# Altium schematic sheet Top_Sheet.SchDoc
size A4; DocumentNumber: 1; SheetNumber: 1; SheetTotal: 5
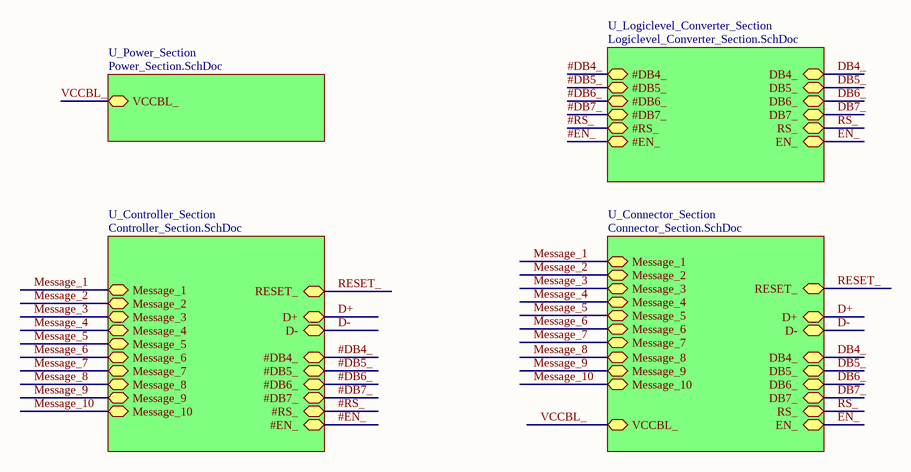
[diagram p0: Top_Sheet.SchDoc]

## Sub-sheets
U_Connector_Section = Connector_Section.SchDoc: RESET_ (bidir), D+ (bidir), Message_7 (bidir), DB4_ (bidir), Message_6 (bidir), Message_5 (bidir), Message_4 (bidir), Message_3 (bidir), Message_2 (bidir), Message_1 (bidir), Message_10 (bidir), Message_8 (bidir), Message_9 (bidir), D- (bidir), DB5_ (bidir), DB6_ (bidir), DB7_ (bidir), RS_ (bidir), EN_ (bidir), VCCBL_ (bidir)
U_Controller_Section = Controller_Section.SchDoc: D+ (bidir), RESET_ (bidir), D- (bidir), #DB4_ (bidir), #DB5_ (bidir), #DB6_ (bidir), #DB7_ (bidir), #RS_ (bidir), #EN_ (bidir), Message_10 (bidir), Message_9 (bidir), Message_8 (bidir), Message_7 (bidir), Message_6 (bidir), Message_5 (bidir), Message_4 (bidir), Message_3 (bidir), Message_2 (bidir), Message_1 (bidir)
U_Logiclevel_Converter_Section = Logiclevel_Converter_Section.SchDoc: DB4_ (bidir), DB5_ (bidir), DB6_ (bidir), DB7_ (bidir), RS_ (bidir), EN_ (bidir), #DB4_ (bidir), #DB5_ (bidir), #DB6_ (bidir), #DB7_ (bidir), #RS_ (bidir), #EN_ (bidir)
U_Power_Section = Power_Section.SchDoc: VCCBL_ (bidir)

## Nets
#DB4_: sheet U_Controller_Section/#DB4_, sheet U_Logiclevel_Converter_Section/#DB4_
#DB5_: sheet U_Controller_Section/#DB5_, sheet U_Logiclevel_Converter_Section/#DB5_
#DB6_: sheet U_Controller_Section/#DB6_, sheet U_Logiclevel_Converter_Section/#DB6_
#DB7_: sheet U_Controller_Section/#DB7_, sheet U_Logiclevel_Converter_Section/#DB7_
#EN_: sheet U_Controller_Section/#EN_, sheet U_Logiclevel_Converter_Section/#EN_
#RS_: sheet U_Controller_Section/#RS_, sheet U_Logiclevel_Converter_Section/#RS_
D+: sheet U_Controller_Section/D+, sheet U_Connector_Section/D+
D-: sheet U_Controller_Section/D-, sheet U_Connector_Section/D-
DB4_: sheet U_Connector_Section/DB4_, sheet U_Logiclevel_Converter_Section/DB4_
DB5_: sheet U_Connector_Section/DB5_, sheet U_Logiclevel_Converter_Section/DB5_
DB6_: sheet U_Connector_Section/DB6_, sheet U_Logiclevel_Converter_Section/DB6_
DB7_: sheet U_Connector_Section/DB7_, sheet U_Logiclevel_Converter_Section/DB7_
EN_: sheet U_Connector_Section/EN_, sheet U_Logiclevel_Converter_Section/EN_
Message_1: sheet U_Controller_Section/Message_1, sheet U_Connector_Section/Message_1
Message_2: sheet U_Controller_Section/Message_2, sheet U_Connector_Section/Message_2
Message_3: sheet U_Controller_Section/Message_3, sheet U_Connector_Section/Message_3
Message_4: sheet U_Controller_Section/Message_4, sheet U_Connector_Section/Message_4
Message_5: sheet U_Controller_Section/Message_5, sheet U_Connector_Section/Message_5
Message_6: sheet U_Controller_Section/Message_6, sheet U_Connector_Section/Message_6
Message_7: sheet U_Controller_Section/Message_7, sheet U_Connector_Section/Message_7
Message_8: sheet U_Controller_Section/Message_8, sheet U_Connector_Section/Message_8
Message_9: sheet U_Controller_Section/Message_9, sheet U_Connector_Section/Message_9
Message_10: sheet U_Controller_Section/Message_10, sheet U_Connector_Section/Message_10
RESET_: sheet U_Controller_Section/RESET_, sheet U_Connector_Section/RESET_
RS_: sheet U_Connector_Section/RS_, sheet U_Logiclevel_Converter_Section/RS_
VCCBL_: sheet U_Power_Section/VCCBL_, sheet U_Connector_Section/VCCBL_